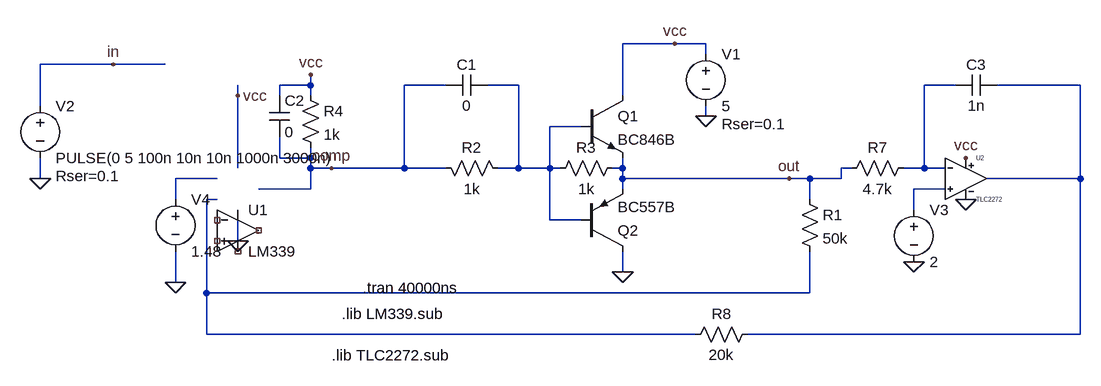
[diagram p0: schematic pull_push_lm339.asc]
pull_push_lm339.asc, the LTspice schematic file:
Version 4
SHEET 1 1088 680
WIRE 224 -16 144 -16
WIRE 272 -16 224 -16
WIRE 272 0 272 -16
WIRE -640 16 -752 16
WIRE -560 16 -640 16
WIRE -336 48 -336 32
WIRE -336 48 -384 48
WIRE -128 48 -192 48
WIRE -16 48 -64 48
WIRE 656 48 608 48
WIRE 848 48 720 48
WIRE -448 64 -448 48
WIRE -384 64 -384 48
WIRE -336 64 -336 48
WIRE 144 64 144 -16
WIRE -752 80 -752 16
WIRE 272 96 272 80
WIRE 80 112 32 112
WIRE -384 160 -384 128
WIRE -336 160 -336 144
WIRE -336 160 -384 160
WIRE -448 176 -448 64
WIRE -336 176 -336 160
WIRE -304 176 -336 176
WIRE -192 176 -192 48
WIRE -192 176 -304 176
WIRE -128 176 -192 176
WIRE -16 176 -16 48
WIRE -16 176 -48 176
WIRE 32 176 32 112
WIRE 32 176 -16 176
WIRE 48 176 32 176
WIRE 144 176 144 160
WIRE 144 176 128 176
WIRE 496 176 480 176
WIRE 608 176 608 48
WIRE 608 176 576 176
WIRE 640 176 608 176
WIRE -752 192 -752 160
WIRE -480 192 -544 192
WIRE 144 192 144 176
WIRE 400 192 144 192
WIRE 432 192 400 192
WIRE 480 192 480 176
WIRE 480 192 432 192
WIRE 848 192 848 48
WIRE 848 192 704 192
WIRE -336 208 -336 176
WIRE -336 208 -416 208
WIRE 144 208 144 192
WIRE 640 208 592 208
WIRE -544 224 -544 192
WIRE -480 224 -496 224
WIRE 432 224 432 192
WIRE 592 240 592 208
WIRE 32 256 32 176
WIRE 80 256 32 256
WIRE -448 288 -448 240
WIRE 144 336 144 304
WIRE -544 352 -544 304
WIRE -496 368 -496 224
WIRE 432 368 432 304
WIRE 432 368 -496 368
WIRE -496 432 -496 368
WIRE 256 432 -496 432
WIRE 848 432 848 192
WIRE 848 432 336 432
FLAG 144 336 0
FLAG 272 96 0
FLAG 400 192 out
FLAG -752 192 0
FLAG 224 -16 vcc
FLAG -336 32 vcc
FLAG -640 16 in
FLAG -304 176 comp
FLAG -448 288 0
FLAG -544 352 0
FLAG -448 64 vcc
FLAG 672 160 vcc
FLAG 672 224 0
FLAG 592 320 0
SYMBOL npn 80 64 R0
SYMATTR InstName Q1
SYMATTR Value BC846B
SYMBOL pnp 80 304 M180
SYMATTR InstName Q2
SYMATTR Value BC557B
SYMBOL voltage 272 -16 R0
WINDOW 123 0 0 Left 2
WINDOW 39 24 124 Left 2
SYMATTR SpiceLine Rser=0.1
SYMATTR InstName V1
SYMATTR Value 5
SYMBOL voltage -752 64 R0
WINDOW 123 0 0 Left 2
WINDOW 39 24 124 Left 2
SYMATTR SpiceLine Rser=0.1
SYMATTR InstName V2
SYMATTR Value PULSE(0 5 100n 10n 10n 1000n 3000n)
SYMBOL res -144 160 M90
WINDOW 0 0 56 VBottom 2
WINDOW 3 32 56 VTop 2
SYMATTR InstName R2
SYMATTR Value 1k
SYMBOL cap -64 32 R90
WINDOW 0 0 32 VBottom 2
WINDOW 3 32 32 VTop 2
SYMATTR InstName C1
SYMATTR Value 0
SYMBOL res 416 208 R0
SYMATTR InstName R1
SYMATTR Value 50k
SYMBOL res 144 160 R90
WINDOW 0 0 56 VBottom 2
WINDOW 3 32 56 VTop 2
SYMATTR InstName R3
SYMATTR Value 1k
SYMBOL res -352 48 R0
SYMATTR InstName R4
SYMATTR Value 1k
SYMBOL Comparators\\LM339 -448 208 R0
SYMATTR InstName U1
SYMBOL cap -400 64 R0
SYMATTR InstName C2
SYMATTR Value 0
SYMBOL res 592 160 R90
WINDOW 0 0 56 VBottom 2
WINDOW 3 32 56 VTop 2
SYMATTR InstName R7
SYMATTR Value 4.7k
SYMBOL cap 720 32 R90
WINDOW 0 0 32 VBottom 2
WINDOW 3 32 32 VTop 2
SYMATTR InstName C3
SYMATTR Value 1n
SYMBOL res 352 416 R90
WINDOW 0 0 56 VBottom 2
WINDOW 3 32 56 VTop 2
SYMATTR InstName R8
SYMATTR Value 20k
SYMBOL voltage 592 224 R0
WINDOW 123 0 0 Left 2
WINDOW 39 0 0 Left 2
SYMATTR InstName V3
SYMATTR Value 2
SYMBOL voltage -544 208 R0
WINDOW 123 0 0 Left 2
WINDOW 39 0 0 Left 2
SYMATTR InstName V4
SYMATTR Value 1.48
SYMBOL Opamps\\TLC2272 672 128 R0
SYMATTR InstName U2
TEXT -256 360 Left 2 !.tran 40000ns
TEXT -288 400 Left 2 !.lib LM339.sub
TEXT -304 464 Left 2 !.lib TLC2272.sub

The netlist it stands for:
* pull_push_lm339.asc
Q1 vcc N001 out 0 BC846B
Q2 0 N001 out 0 BC557B
V1 vcc 0 5 Rser=0.1
V2 in 0 PULSE(0 5 100n 10n 10n 1000n 3000n) Rser=0.1
R2 comp N001 1k
C1 N001 comp 0
R1 out N006 50k
R3 out N001 1k
R4 vcc comp 1k
XU1 NC_01 NC_02 0 NC_03 NC_04 LM339  ; pins In+ In- V+ V- OUT
C2 vcc comp 0
R7 N002 out 4.7k
C3 N003 N002 1n
R8 N003 N006 20k
V3 N005 0 2
V4 N004 0 1.48
XU2 N005 N002 vcc 0 N003 TLC2272  ; pins In+ In- V+ V- OUT
.model NPN NPN
.model PNP PNP
.lib standard.bjt
.tran 40000ns
.lib LM339.sub
.lib TLC2272.sub
.lib LM339.sub
.lib LTC.lib
.backanno
.end